# Altium schematic sheet ESP32_module.SchDoc
size 431 x 279 mm; Organization: ORGANIZATION; Address1: ADDRESS 1; Address2: ADDRESS 2; Address3: ADDRESS 3; Address4: ADDRESS 4; Revision: -; SheetNumber: 2; SheetTotal: 5; ENG_APP_DATE: --/--/--; DSN_APP_DATE: --/--/--; CHK_APP_DATE: --/--/--
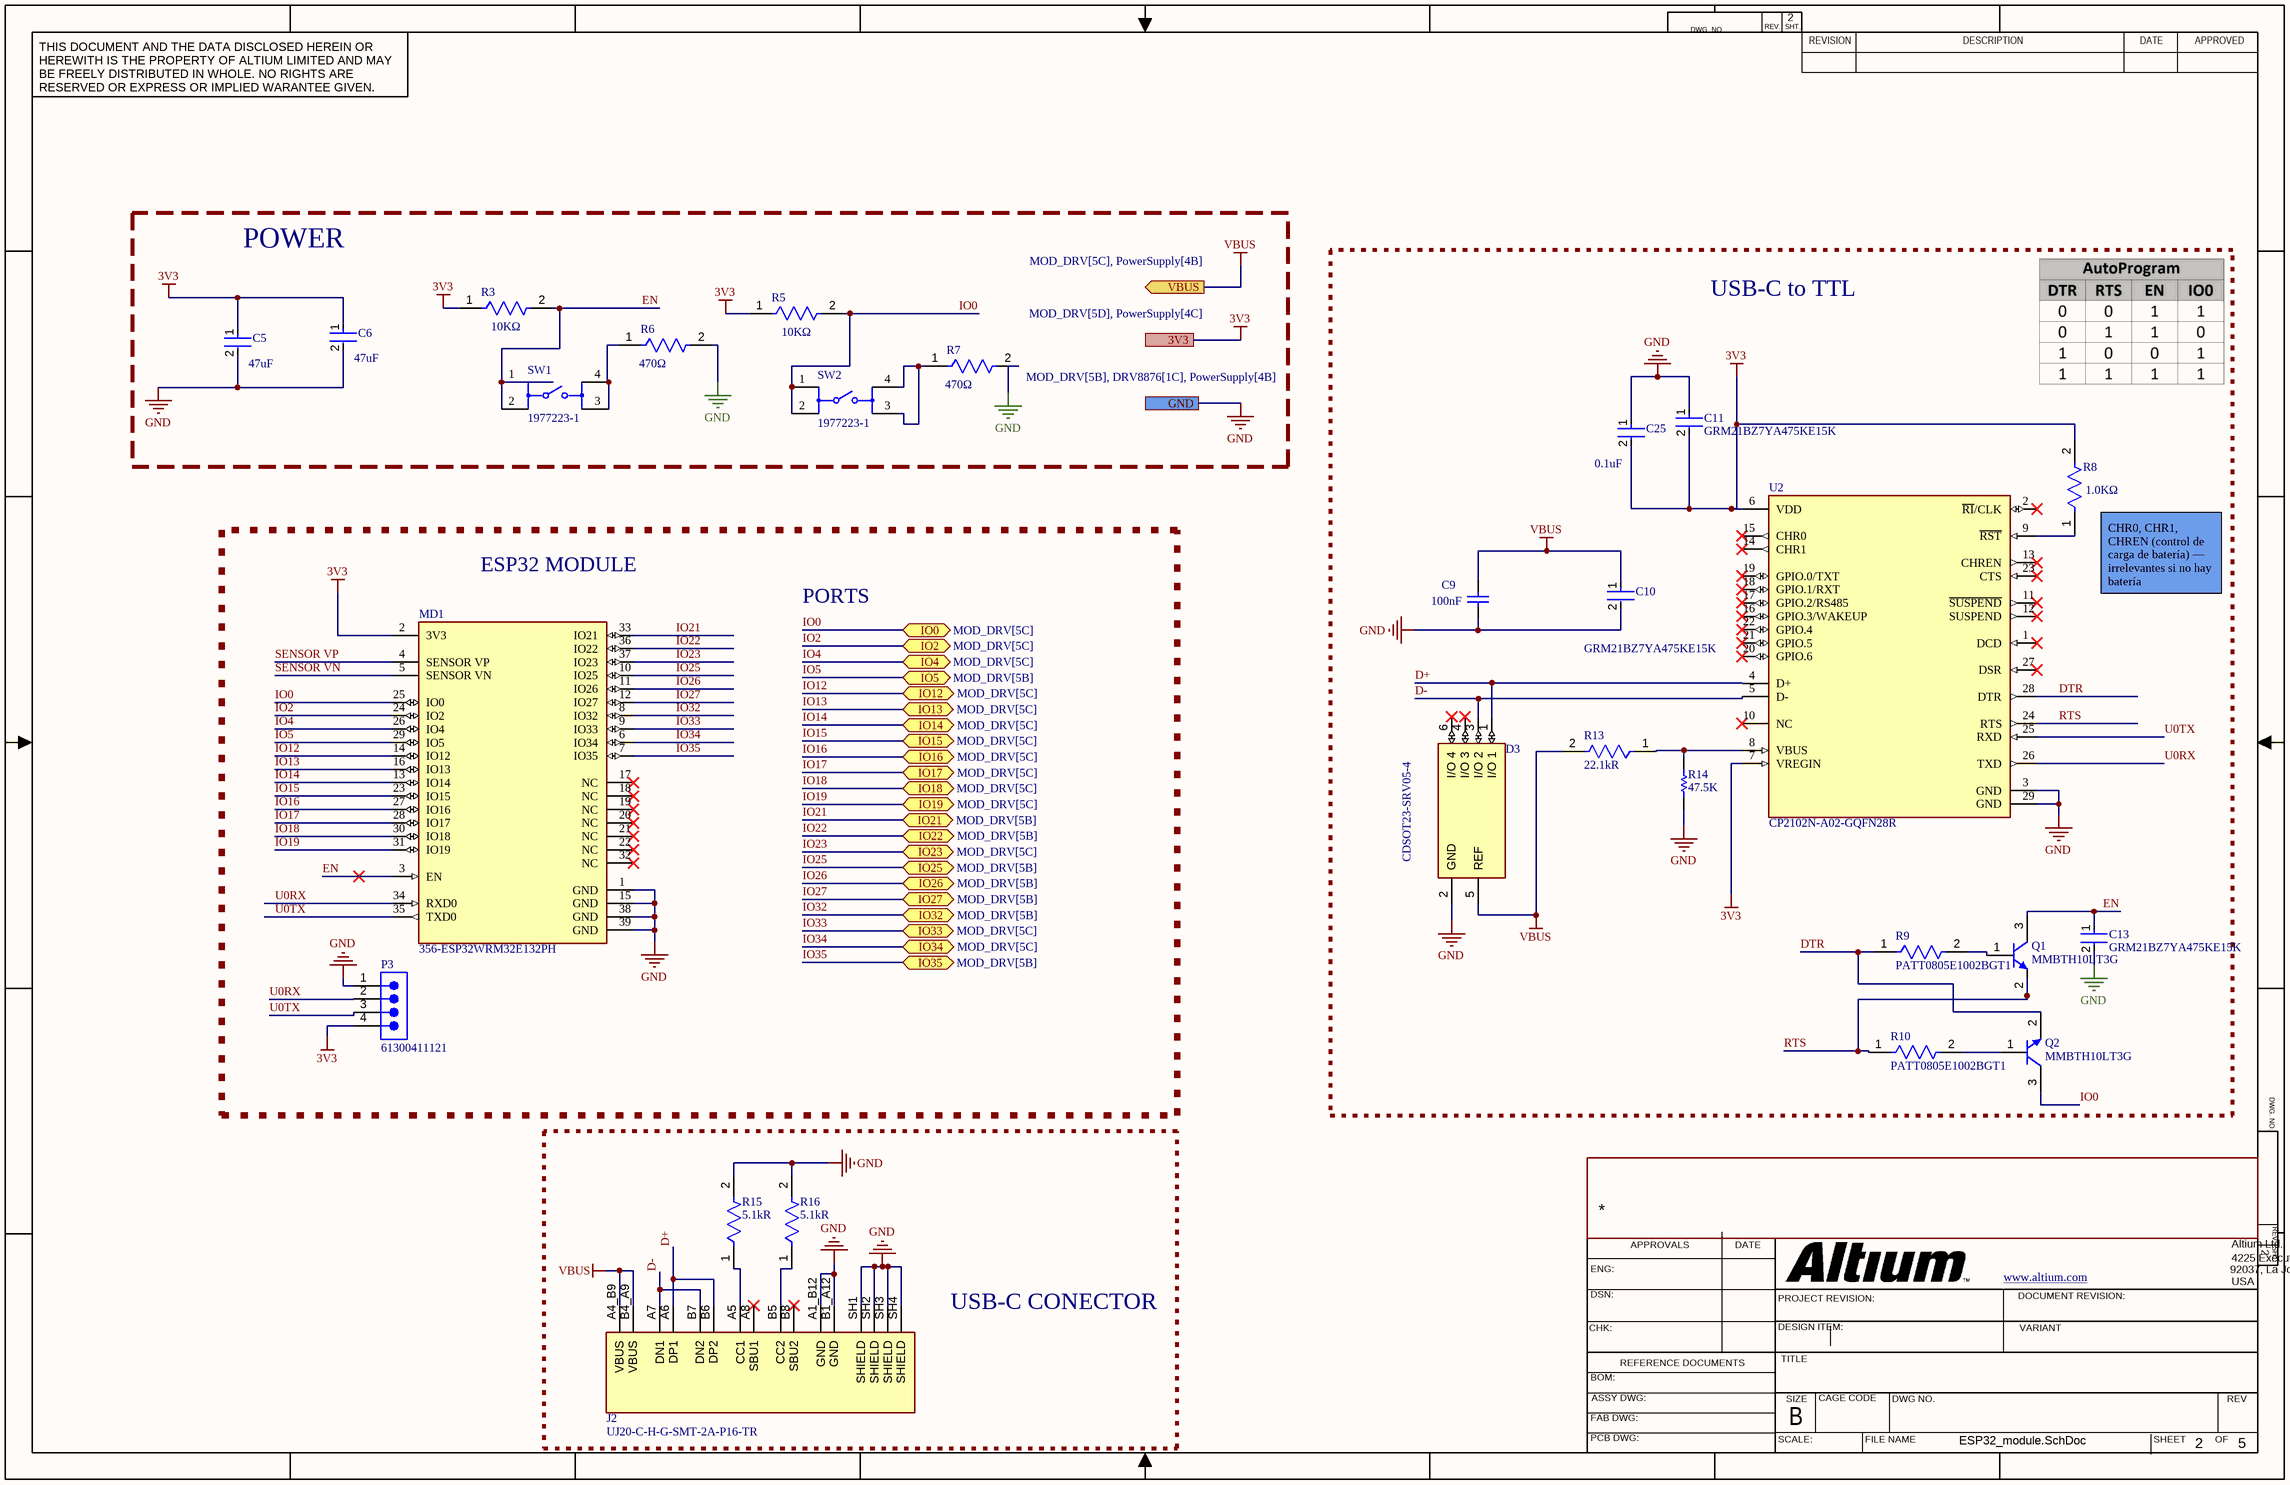
[diagram p0: ESP32_module.SchDoc]

## Parts
C5  Capacitance: 47uF  [FP-GRM31C-0_3-IPC_C]  (hidden comment: GRM31CR61E476ME44L)
C6  Capacitance: 47uF  [FP-GRM31C-0_3-IPC_C]  (hidden comment: GRM31CR61E476ME44L)
C9  100nF  [CAPC2013X145X50NL20T25]
C10  GRM21BZ7YA475KE15K  [FP-GRM21B-0_2-e0_2_0_7-IPC_A]
C11  GRM21BZ7YA475KE15K  [FP-GRM21B-0_2-e0_2_0_7-IPC_A]
C13  GRM21BZ7YA475KE15K  [FP-GRM21B-0_2-e0_2_0_7-IPC_A]
C25  Parameter 1: 0.1uF  [FP-GRM155-0_05-MFG]  (hidden comment: GRM155R71H104KE14D)
D3  CDSOT23-SRV05-4  [FP-CDSOT23-SRV05-4-MFG]
J2  UJ20-C-H-G-SMT-2A-P16-TR  [SAMESKY_UJ20-C-H-G-SMT-2A-P16-TR]
MD1  356-ESP32WRM32E132PH  [FP-ESP32-WROOM-32E_4MB-MFG]
P3  61300411121  [61300411121]
Q1  MMBTH10LT3G  [ONSC-SOT-23-3-318-08_V]
Q2  MMBTH10LT3G  [ONSC-SOT-23-3-318-08_V]
R3  value 10KΩ  [FP-RT0805-MFG]  (hidden comment: RT0805FRD0710KL)
R5  value 10KΩ  [FP-RT0805-MFG]  (hidden comment: RT0805FRD0710KL)
R6  value 470Ω  [FP-AC0805-MFG]  (hidden comment: AC0805FR-07470RL)
R7  value 470Ω  [FP-AC0805-MFG]  (hidden comment: AC0805FR-07470RL)
R8  value 1.0KΩ  [FP-RP732B-MFG]  (hidden comment: RP73D2B1K0BTDF)
R9  PATT0805E1002BGT1  [FP-PATT0805-MFG]
R10  PATT0805E1002BGT1  [FP-PATT0805-MFG]
R13  Resistance: 22.1kR  [FP-RN732A-IPC_C]  (hidden comment: RN732ATTDK2212B25)
R14  47.5K  [RESC1005X40X25NL10T10]
R15  Resistance: 5.1kR  [FP-AC0603-IPC_C]  (hidden comment: AC0603JR-075K1L)
R16  Resistance: 5.1kR  [FP-AC0603-IPC_C]  (hidden comment: AC0603JR-075K1L)
SW1  1977223-1  [FP-1977223-1-MFG]
SW2  1977223-1  [FP-1977223-1-MFG]
U2  CP2102N-A02-GQFN28R  [FP-CP2102N-A02-GQFN28R-MFG]

## Blocks framed on the sheet
POWER: C5 C6 R3 R5-R7 SW1 SW2
USB-C to TTL: C9-C11 C13 C25 D3 Q1 Q2 R8-R10 R13 R14 U2
USB-C CONECTOR: J2 R15 R16

## Ports
3V3 (see MOD_DRV[5D], PowerSupply[4C]), GND (see MOD_DRV[5B], DRV8876[1C], PowerSupply[4B]), IO0 (bidir, see MOD_DRV[5C]), IO2 (bidir, see MOD_DRV[5C]), IO4 (bidir, see MOD_DRV[5C]), IO5 (bidir, see MOD_DRV[5B]), IO12 (bidir, see MOD_DRV[5C]), IO13 (bidir, see MOD_DRV[5C]), IO14 (bidir, see MOD_DRV[5C]), IO15 (bidir, see MOD_DRV[5C]), IO16 (bidir, see MOD_DRV[5C]), IO17 (bidir, see MOD_DRV[5C]), IO18 (bidir, see MOD_DRV[5C]), IO19 (bidir, see MOD_DRV[5C]), IO21 (bidir, see MOD_DRV[5B]), IO22 (bidir, see MOD_DRV[5B]), IO23 (bidir, see MOD_DRV[5C]), IO25 (bidir, see MOD_DRV[5B]), IO26 (bidir, see MOD_DRV[5B]), IO27 (bidir, see MOD_DRV[5B]), IO32 (bidir, see MOD_DRV[5B]), IO33 (bidir, see MOD_DRV[5C]), IO34 (bidir, see MOD_DRV[5C]), IO35 (bidir, see MOD_DRV[5B]), VBUS (out, see MOD_DRV[5C], PowerSupply[4B])

## Nets
3V3: C5.1 C6.1 C11.2 C25.2 MD1.2(3V3) P3.4 R3.1 R5.1 R8.2 U2.6(VDD) U2.7(VREGIN) ; port 3V3
GND: C5.2 C6.2 C9.1 C10.2 C11.1 C13.2 C25.1 D3.2(GND) J2.A1_B12(GND) J2.B1_A12(GND) J2.SH1(SHIELD) J2.SH2(SHIELD) J2.SH3(SHIELD) J2.SH4(SHIELD) MD1.1(GND) MD1.15(GND) MD1.38(GND) MD1.39(GND) P3.1 R6.2 R7.2 R14.1 R15.2 R16.2 U2.3(GND) U2.29(GND) ; port GND
VBUS: C9.2 C10.1 D3.5(REF) J2.A4_B9(VBUS) J2.B4_A9(VBUS) R13.2 ; port VBUS
D+: D3.1(I/O_1) J2.A6(DP1) J2.B6(DP2) U2.4(D+)
D-: D3.3(I/O_2) J2.A7(DN1) J2.B7(DN2) U2.5(D-)
DTR: Q2.2(E) R9.1 U2.28(DTR)
EN: C13.1 MD1.3(EN) Q1.3(C) R3.2 SW1.1 SW1.2
IO0: MD1.25(IO0) Q2.3(C) R5.2 SW2.1 SW2.2 ; port IO0
IO2: MD1.24(IO2) ; port IO2
IO4: MD1.26(IO4) ; port IO4
IO5: MD1.29(IO5) ; port IO5
IO12: MD1.14(IO12) ; port IO12
IO13: MD1.16(IO13) ; port IO13
IO14: MD1.13(IO14) ; port IO14
IO15: MD1.23(IO15) ; port IO15
IO16: MD1.27(IO16) ; port IO16
IO17: MD1.28(IO17) ; port IO17
IO18: MD1.30(IO18) ; port IO18
IO19: MD1.31(IO19) ; port IO19
IO21: MD1.33(IO21) ; port IO21
IO22: MD1.36(IO22) ; port IO22
IO23: MD1.37(IO23) ; port IO23
IO25: MD1.10(IO25) ; port IO25
IO26: MD1.11(IO26) ; port IO26
IO27: MD1.12(IO27) ; port IO27
IO32: MD1.8(IO32) ; port IO32
IO33: MD1.9(IO33) ; port IO33
IO34: MD1.6(IO34) ; port IO34
IO35: MD1.7(IO35) ; port IO35
RTS: Q1.2(E) R10.1 U2.24(RTS)
SENSOR VN: MD1.5(SENSOR_VN)
SENSOR VP: MD1.4(SENSOR_VP)
U0RX: MD1.34(RXD0) P3.2 U2.26(TXD)
U0TX: MD1.35(TXD0) P3.3 U2.25(RXD)
NetJ2_A5: J2.A5(CC1) R15.1
NetJ2_B5: J2.B5(CC2) R16.1
NetQ1_1: Q1.1(B) R9.2
NetQ2_1: Q2.1(B) R10.2
NetR6_1: R6.1 SW1.3 SW1.4
NetR7_1: R7.1 SW2.3 SW2.4
NetR8_1: R8.1 U2.9(~{RST})
NetR13_1: R13.1 R14.2 U2.8(VBUS)

Not connected (* = marked no-connect by the designer): D3 4(I/O_3)* 6(I/O_4)*; J2 A8(SBU1)* B8(SBU2)*; MD1 17(NC)* 18(NC)* 19(NC)* 20(NC)* 21(NC)* 22(NC)* 32(NC)*; U2 1(DCD)* 2(~{RI}/CLK)* 10(NC)* 11(~{SUSPEND})* 12(SUSPEND)* 13(CHREN)* 14(CHR1)* 15(CHR0)* 16(GPIO.3/WAKEUP)* 17(GPIO.2/RS485)* 18(GPIO.1/RXT)* 19(GPIO.0/TXT)* 20(GPIO.6)* 21(GPIO.5)* 22(GPIO.4)* 23(CTS)* 27(DSR)*

## Notes on the sheet
- ESP32 MODULE
- PORTS
- (near R8) CHR0, CHR1, CHREN (control de carga de batería) — irrelevantes si no hay batería
- DWG. NO.
- REV.
- SHT.
- THIS DOCUMENT AND THE DATA DISCLOSED HEREIN OR HEREWITH IS THE PROPERTY OF ALTIUM LIMITED AND MAY BE FREELY DISTRIBUTED IN WHOLE. NO RIGHTS ARE RESERVED OR EXPRESS OR IMPLIED WARANTEE GIVEN.
- REVISION
- DESCRIPTION
- DATE
- APPROVED
- ENG:
- DSN:
- APPROVALS
- PROJECT REVISION:
- www.altium.com <http://www.altium.com>
- DOCUMENT REVISION:
- 92037, La Jolla
- USA
- Altium Ltd.
- 4225 Executive Square
- CHK:
- REFERENCE DOCUMENTS
- DESIGN ITEM:
- TITLE
- VARIANT
- BOM:
- FAB DWG:
- PCB DWG:
- ASSY DWG:
- SCALE:
- SIZE
- B
- CAGE CODE
- FILE NAME
- DWG NO.
- SHEET
- OF
- REV

## Library data of the parts
C5 C6 = CMP-06035-000147-1: CAP CER 47UF 25V X5R 1206-GRM31CR61E476ME44L; Tolerance: 20%; Width: 1.6mm; Dielectric: X5R; Thickness: 1.6mm; Length: 3.2mm; Voltage Rating (DC): 25V
C9 = CMP-2007-01227-1: C0805S104K5RACTU; Manufacturer: Kemet; Part Number: C0805S104K5RACTU
C10 = CMP-06035-048385-1: Chip Multilayer Ceramic Capacitors for General Purpose, 0805, 4.7uF, X7R, 15%, 10%, 35V. GRM21BZ7YA475KE15K
C11 = CMP-06035-048385-1: Chip Multilayer Ceramic Capacitors for General Purpose, 0805, 4.7uF, X7R, 15%, 10%, 35V-GRM21BZ7YA475KE15K
C13 = CMP-06035-048385-1: Chip Multilayer Ceramic Capacitors for General Purpose, 0805, 4.7uF, X7R, 15%, 10%, 35V
C25 = CMP-06035-062118-1: Chip Multilayer Ceramic Capacitors for General Purpose, 0402, 0.10uF, X7R, 15%, 20%, 50V; RoHS Compliant: Yes
D3 = CMP-07401-000007-1: TVS DIODE 5V 15V SOT23-6; Manufacturer: Bourns Inc.; Standoff Height: 0.2mm; Direction: Bidirectional; Peak Pulse Power: 500W; Max Junction Temp: +150°C; Number Of Channels: 4; Breakdown Voltage: 6V; Peak Pulse Current: 30A; Temperature Range High: +150°C; RoHS: TRUE; Category: Diode; Clamping Voltage: 15V; Reverse Standoff Voltage: 5V; Manufacturer Part Number: CDSOT23-SRV05-4; Octopart: https://octopart.com/cdsot23-srv05-4-bourns-1679449; Automotive: No; ComponentLink2URL: https://www.bourns.com/docs/Product-Datasheets/CDSOT23-SRV05-4.pdf; Device Class L1: Circuit Protection; Temperature: -55°C to +150°C; Device Class L2: TVS Diodes; Temperature Range Low: -55°C; Lead Free: Yes; Device Class L3: unset; Height: 1.45mm; Package: CDSOT23-SRV05-4; Ipc Land Pattern Name: SOT95P280X118-6; Mouser Description: CDSOT23-SRV05-4, Quad Uni-Directional TVS Diode, 500W, 6-Pin SOT-23; ComponentLink2Description: Datasheet; Digikey Description: TVS DIODE 5V 15V SOT23-6
MD1 = CMP-194065-000026-1: RX TXRX MOD WIFI TRACE ANT SMD
P3 = CMP-1502-01064-4: THT Vertical Pin Header WR-PHD, Pitch 2.54 mm, Single Row, 4 pins; Connector Type: Male Pin; Gender: Male; Current Rating: 3A; Number of Positions: 4; Operating Supply Voltage: 250V; Contact Resistance: 20mΩ; Pitch: 2.54mm; Max Operating Temperature: 105°C; Mount: Through Hole; Contact Material: Gold; Contact Plating: Gold; Number of Contacts: 4; Orientation: Vertical; Packaging: Bulk; Contact Mating Length: 5.9944mm; Voltage Rating: 250V; Number of Rows: 1; Height: 8.89mm; Lead Free: Lead Free; Lead Pitch: 2.54mm; Number of Pins: 4; Color: Black; Min Operating Temperature: -40°C; RoHS: Compliant; Termination: Solder
Q1 Q2 = CMP-1048-00599-1: VHF / UHF Transistor, NPN Silicon, 3-Pin SOT-23, Pb-Free, Tape and Reel; Manufacturer: On Semiconductor; fT Min (MHz): 650; Packing: Tape and Reel; ComponentLink3Description: Package Specification; PartNumber: MMBTH10LT3G; DatasheetVersion: Rev. 5; Polarity: NPN; ComponentLink2Description: Datasheet; ComponentLink1Description: Manufacturer URL; PackageVersion: Rev. AP, 11/2009; ComponentLink1URL: http://www.onsemi.com/; ComponentLink2URL: http://www.onsemi.cn/pub_link/Collateral/MMBTH10LT1-D.PDF; PackageReference: SOT-23-3-318-08; RoHS: TRUE; Mounting Technology: Surface Mount; ComponentLink3URL: http://www.onsemi.cn/pub_link/Collateral/318-08.PDF; PackageDescription: 3-Pin Small Outline Transistor, Body 2.92 x 1.3 mm, Pitch 0.95 mm
R3 R5 = CMP-03412-035478-1: RES SMD 10K OHM 1% 1/8W 0805; Manufacturer: Yageo; Tolerance: 0.0001; Temperature Coefficient: 25 ppm/°C; Power Rating: 0.125W; Voltage Rating: 150V; RoHS: TRUE; Footprint Url: http://www.yageo.com/exep/pages/download/literatures/PYu-R_Mount_10.pdf; Series: RT; Octopart: https://octopart.com/rt0805frd0710kl-yageo-71399701; Digikey Description: RES SMD 10K OHM 1% 1/8W 0805; Composition: Thin Film; Manufacturer Part Number: RT0805FRD0710KL; Device Class L1: Passive Components; Automotive: No; ComponentLink2Description: Datasheet; Ipc Land Pattern Name: RESC200125X50; Device Class L2: Resistors; Resistance: 10KΩ; Temperature Range Low: -55°C; Device Class L3: Chip SMD Resistors; ComponentLink2URL: http://www.yageo.com/documents/recent/PYu-RT_1-to-0.01_RoHS_L_9.pdf; Temperature: -55°C to +155°C; Category: Res; Temperature Range High: +155°C; Lead Free: Yes; Package: RT0805; Height: 0.6mm
R6 R7 = CMP-03412-037267-1: RES SMD 470 OHM 1% 1/8W 0805; Manufacturer: Yageo; Automotive Grade: Grade 0; Tolerance: 0.01; Voltage Rating: 150V; Package: AC0805; Device Class L3: Chip SMD Resistors; Composition: Thick Film; Ipc Land Pattern Name: RESC200125X50; Height: 0.6mm; Device Class L1: Passive Components; Series: AC; Resistance: 470Ω; RoHS: TRUE; Automotive: Yes; ComponentLink2Description: Datasheet; Power Rating: 1/8W; Temperature Range Low: -55°C; Category: Res; Digikey Description: RES SMD 470 OHM 1% 1/8W 0805; Temperature: -55°C to +155°C; ComponentLink2URL: http://www.yageo.com/documents/recent/PYu-AC_51_RoHS_L_6.pdf; Manufacturer Part Number: AC0805FR-07470RL; Mouser Description: Thick Film Resistors 1/8W 470ohm 1% AEC-Q200; Lead Free: Yes; Temperature Range High: +155°C; Device Class L2: Resistors; Octopart: https://octopart.com/ac0805fr-07470rl-yageo-26633242; Footprint Url: http://www.yageo.com/exep/pages/download/literatures/PYu-R_Mount_10.pdf
R8 = CMP-03211-010976-1: Res Thin Film 1206 1.0KΩ 0.1% 0.25W 15ppm/°C Molded SMD; Manufacturer: TE Connectivity; Voltage Rating: 200V; Lead Free: Yes; RoHS: TRUE; Category: Res; Tolerance: 0.1%; Octopart: https://octopart.com/rp73d2b1k0btdf-te+connectivity-22741139; packaging: 1000 Reel; Device Class L2: Resistors; Power Rating: 0.25W; Device Class L1: Passive Components; Device Class L3: Chip SMD Resistors; Temperature Range Low: -55°C; Package: RP732B; Series: RP73; Height: 0.65mm; Composition: Thin Film; Temperature Range High: 155°C; Automotive: No; Temperature Coefficient: 15ppm/°C; octopart_url: https://octopart.com/rp73d2b1k0btdf-te+connectivity-22741139; Temperature: -55°C to 155°C; Ipc Land Pattern Name: RESC305155X55; ComponentLink2Description: Datasheet; Resistance: 1.0KΩ; Manufacturer Part Number: RP73D2B1K0BTDF; ComponentLink2URL: https://www.te.com/commerce/DocumentDelivery/DDEController?Action=showdoc&DocId=Data+Sheet%7F1773272%7FL%7Fpdf%7FEnglish%7FENG_DS_1773272_L.pdf%7F8-1879255-6
R9 R10 = CMP-02407-000039-1: RES SMD 10K OHM 0.1% 1/5W 0805; Manufacturer: Vishay; Resistance: 10kΩ; Value: 10kΩ; Automotive Grade: Grade 0; Temperature Coefficient: 25ppm/°C; Power Rating: 200mW; Voltage Rating: 100V; Category: Res; RoHS: TRUE; Tolerance: 0.1%; Digikey Description: RES SMD 10K OHM 0.1% 1/5W 0805; Height: 0.018inch; Automotive: Yes; Package: PATT0805; Manufacturer Part Number: PATT0805E1002BGT1; Octopart: https://octopart.com/patt0805e1002bgt1-vishay-34963131; Device Class L3: Chip SMD Resistors; Temperature Range High: +250°C; Series: PATT; Temperature: -55°C to +250°C; ComponentLink2URL: http://www.vishay.com/docs/60124/patt.pdf; Ipc Land Pattern Name: RESC203127X38; Composition: Thin Film; Device Class L2: Resistors; Temperature Range Low: -55°C; Lead Free: Yes; ComponentLink2Description: Datasheet; Footprint Url: http://www.vishay.com/docs/60119/landpatterns.pdf; Device Class L1: Passive Components
R13 = CMP-04015-002277-1: 22.1kΩ ±0.1% 0.1W, 1/10W Chip Resistor 0805 (2012 Metric) Moisture Resistant Thin Film; Power Rating: 100mW; Temperature Coefficient: 25ppm/°C; Voltage Rating (DC): 100V; Length: 2mm; Max Operating Temperature: 125°C; Packaging: Tape and Reel; Tolerance: 0.1%; Case/Package: 0805; Height: 0.5mm; Weight: 0.000194oz; Termination: SMD/SMT; Composition: Thin Film; Case Code (Imperial): 0805; Width: 1.2mm; Case Code (Metric): 2012; Voltage Rating: 100V; Min Operating Temperature: -55°C
R14 = CMP-2002-06222-1: MC00625W0402147K5; Manufacturer: Multicomp; Part Number: MC00625W0402147K5
R15 R16 = CMP-03412-043833-1: RES 5.1kΩ 5.00% 0.1W 0603; Power Rating: 100mW; Temperature Coefficient: 100ppm/°C; Tolerance: 5%; Voltage Rating: 50V; Width: 0.8mm; Case Code (Imperial): 0603; Packaging: Tape and Reel; Number of Terminations: 2; Termination: SMD/SMT; Lead Free: Lead Free; RoHS Compliant: Yes; Min Operating Temperature: -55°C; Case Code (Metric): 1608; Resistor Type: Thick Film; Case/Package: 0603; Size Code: 0603; Features: Moisture Resistant; Series: AC; Weight: 7.1E-05oz; Height: 0.022inch; Max Operating Temperature: 155°C; Max Power Dissipation: 100mW; Length: 0.063inch
SW1 SW2 = CMP-03790-42203485-1: 1977223-1 Pushbutton Switch, SPST, Momentary, 0.05A, 24VDC, Solder Terminal, Panel Mount; Manufacturer Lifecycle Status: ACTIVE; Switch Function: Off-Mom; Illumination Type: Illuminated, Non-Illuminated; Max Voltage Rating (DC): 24V; Switch Travel: 250µm; Number of Positions: 2; Contact Current Rating: 50mA; Mechanical Life: 1Mcycles; Actuator Length: 700µm; Actuator Material: Nylon, Polyamide; Max Operating Temperature: 105°C; Packaging: Bulk; Type: Switch; Material: Polyamide; Termination: Gull Wing; Voltage Rating (DC): 24V; Height: 4.3mm; NexarPartId: 42203485; Contact Plating: Silver; Lifecycle Status: Production; RoHS: Compliant; Radiation Hardening: No; Case/Package: SMD/SMT; Throw Configuration: SPST; REACH SVHC: No SVHC; Current Rating: 50mA; Mount: Surface Mount; Min Operating Temperature: -40°C; Housing Material: Polyphenylene; ELV: Compliant
U2 = CMP-08093-000007-1: IC USB TO UART BRIDGE QFN28
J2 = UJ20-C-H-G-SMT-2A-P16-TR: Package: None; Price: None; Value: *; MP: UJ20-C-H-G-SMT-2A-P16-TR; Availability: Unavailable